# EasyEDA schematic SCH_Informe-02-IB3_2026-10-10.json
TITLE: Sheet_1; REV: 1.0; Date: 2026-10-10; Sheet: 1/1; Drawn By: cristian.castillo2; Company: Your Company
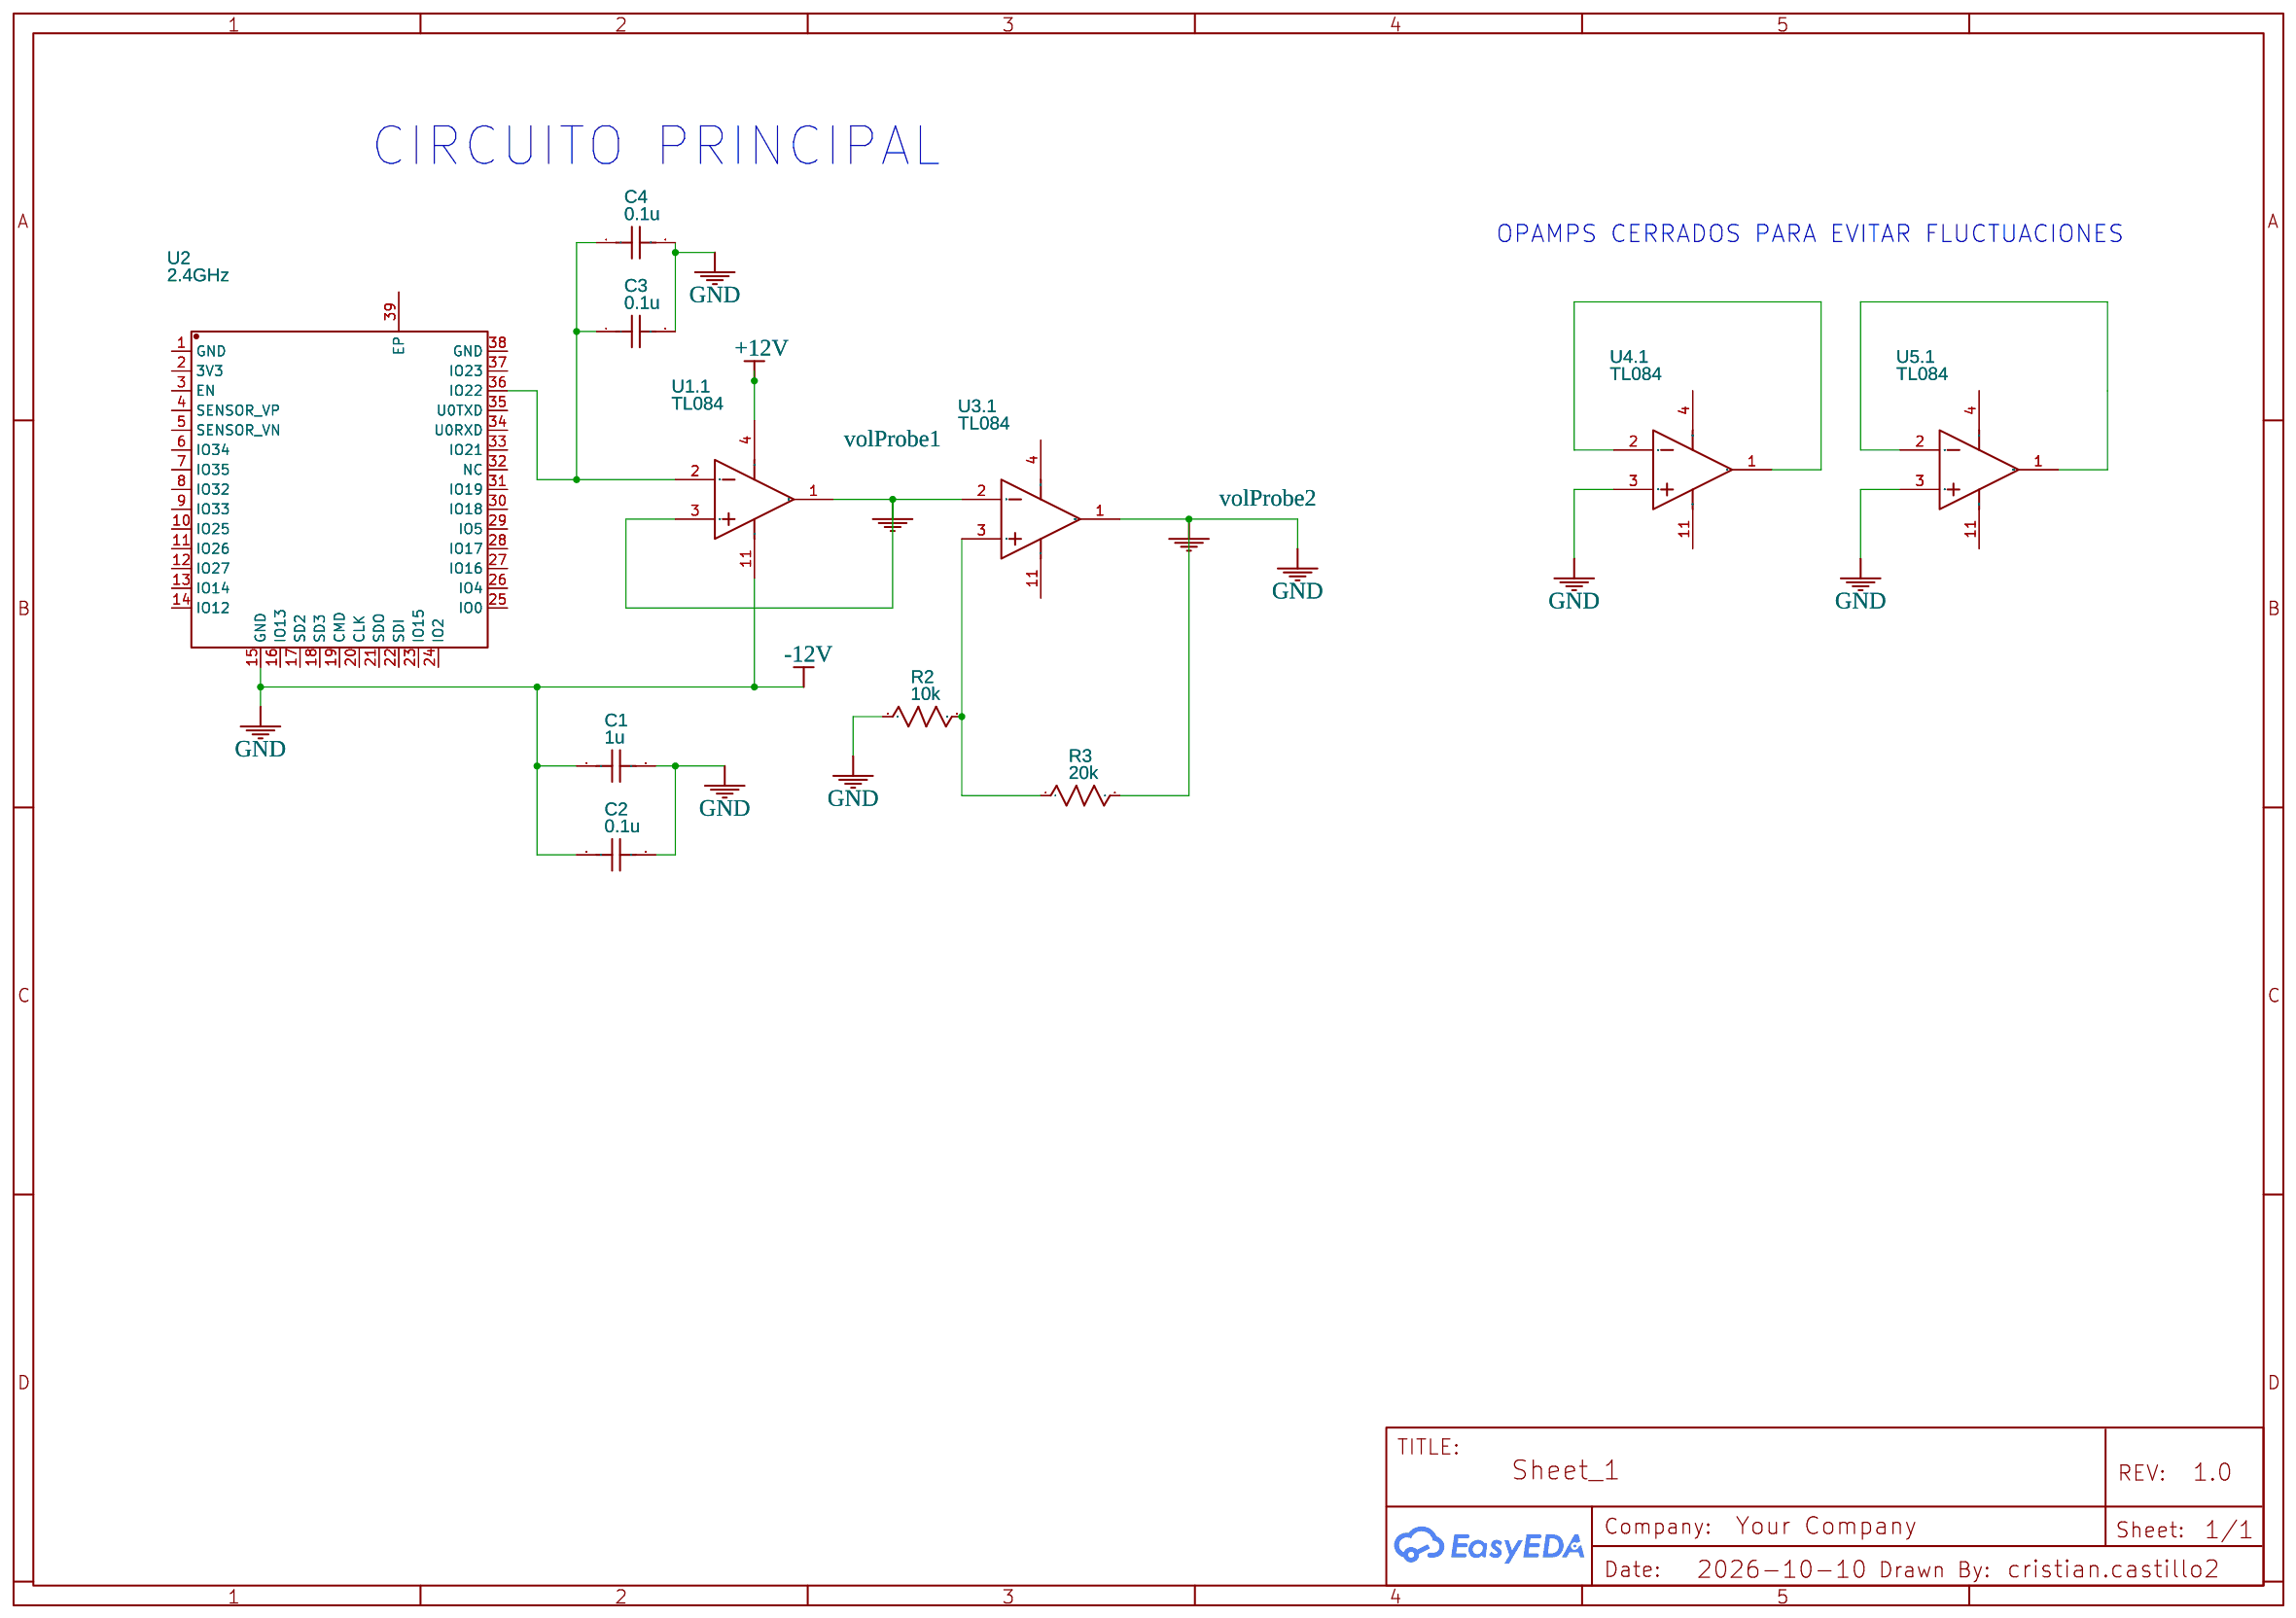
[diagram p0: schematic sheet]

## Parts
C1  1u  [C0603]
C2  0.1u  [C0603]
C3  0.1u  [C0603]
C4  0.1u  [C0603]
R2  10k  [R0603]
R3  20k  [R0603]
U1  TL084  [SOP-14_L8.6-W3.9-P1.27-LS6.0-BL]  (section 1)
U2  2.4GHz  [WIRELM-SMD_ESP32-S]
U3  TL084  [SOP-14_L8.6-W3.9-P1.27-LS6.0-BL]  (section 1)
U4  TL084  [SOP-14_L8.6-W3.9-P1.27-LS6.0-BL]  (section 1)
U5  TL084  [SOP-14_L8.6-W3.9-P1.27-LS6.0-BL]  (section 1)

## Library data of the parts
C1-C4 = C_0603_US: Contributor: LCEDA_Lib
R2 R3 = R_0603_US: Contributor: LCEDA_Lib
U1 U3-U5 = TL084: subpart_no: 1; Supplier: LCSC; Supplier Part: C504548; Manufacturer: Gcore(扬州国芯); JLCPCB Part Class: Extended Part
U2 = ESP32-S: Contributor: LCSC; Supplier: LCSC; Supplier Part: C277944; Manufacturer: Ai-Thinker(安信可); JLCPCB Part Class: Extended Part

## Nets
+12V: U1.4(VCC+)
-12V: C1.1 C1.2 C2.1 C2.2 C3.2 C4.2 R2.1 R3.2 U1.11(VCC-) U2.15(GND) U3.1(OUT1) U4.3(IN1+) U5.3(IN1+)
volProbe1: U1.1(OUT1) U1.3(IN1+) U3.2(IN1-)
Net-(C3-1): C3.1 C4.1 U1.2(IN1-) U2.36(IO22)
Net-(R2-2): R2.2 R3.1 U3.3(IN1+)
Net-(U4.1-1): U4.1(OUT1) U4.2(IN1-)
Net-(U5.1-1): U5.1(OUT1) U5.2(IN1-)

Not connected (* = marked no-connect by the designer): U2 1(GND) 2(3V3) 3(EN) 4(SENSOR_VP) 5(SENSOR_VN) 6(IO34) 7(IO35) 8(IO32) 9(IO33) 10(IO25) 11(IO26) 12(IO27) 13(IO14) 14(IO12) 16(IO13) 17(SD2) 18(SD3) 19(CMD) 20(CLK) 21(SDO) 22(SDI) 23(IO15) 24(IO2) 25(IO0) 26(IO4) 27(IO16) 28(IO17) 29(IO5) 30(IO18) 31(IO19) 32(NC) 33(IO21) 34(U0RXD) 35(U0TXD) 37(IO23) 38(GND) 39(EP); U3 4(VCC+) 11(VCC-); U4 4(VCC+) 11(VCC-); U5 4(VCC+) 11(VCC-)

## Notes on the sheet
- CIRCUITO PRINCIPAL
- OPAMPS CERRADOS PARA EVITAR FLUCTUACIONES
